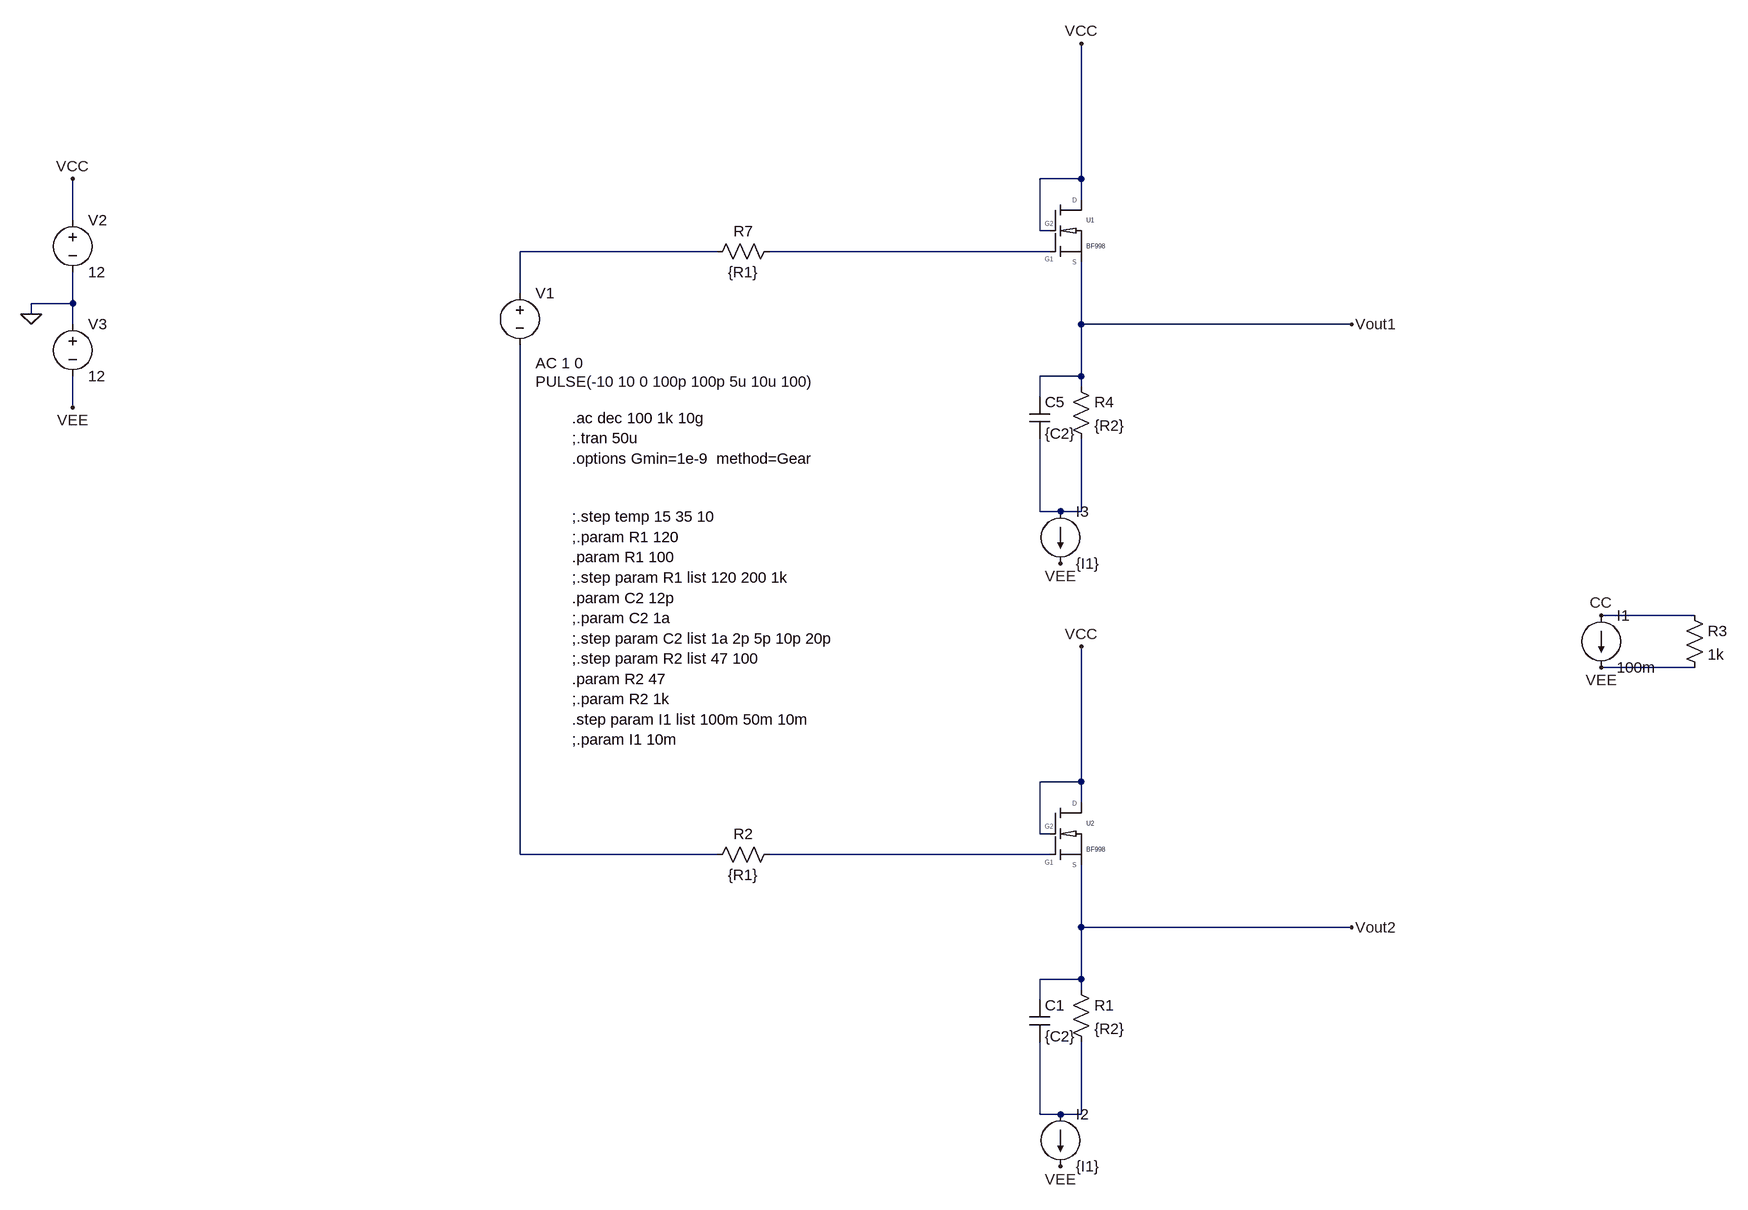
[diagram p0: schematic differential_probe_input_fet_bf998_one.asc]
differential_probe_input_fet_bf998_one.asc, the LTspice schematic file:
Version 4
SHEET 1 1224 1756
WIRE 224 96 224 -112
WIRE 224 96 160 96
WIRE 224 128 224 96
WIRE -1328 160 -1328 96
WIRE 160 176 160 96
WIRE 176 176 160 176
WIRE -336 208 -640 208
WIRE 176 208 -256 208
WIRE -640 272 -640 208
WIRE -1328 288 -1328 240
WIRE -1328 288 -1392 288
WIRE -1392 304 -1392 288
WIRE -1328 320 -1328 288
WIRE 224 320 224 224
WIRE 640 320 224 320
WIRE 224 400 224 320
WIRE 224 400 160 400
WIRE 224 416 224 400
WIRE 160 432 160 400
WIRE -1328 448 -1328 400
WIRE 160 608 160 496
WIRE 192 608 160 608
WIRE 224 608 224 496
WIRE 224 608 192 608
WIRE 1168 768 1024 768
WIRE 1168 848 1024 848
WIRE 224 1024 224 816
WIRE 224 1024 160 1024
WIRE 224 1056 224 1024
WIRE 160 1104 160 1024
WIRE 176 1104 160 1104
WIRE -640 1136 -640 352
WIRE -336 1136 -640 1136
WIRE 176 1136 -256 1136
WIRE 224 1248 224 1152
WIRE 640 1248 224 1248
WIRE 224 1328 224 1248
WIRE 224 1328 160 1328
WIRE 224 1344 224 1328
WIRE 160 1360 160 1328
WIRE 160 1536 160 1424
WIRE 192 1536 160 1536
WIRE 224 1536 224 1424
WIRE 224 1536 192 1536
FLAG 640 320 Vout1
FLAG -1392 304 0
FLAG 640 1248 Vout2
FLAG -1328 96 VCC
FLAG 224 -112 VCC
FLAG -1328 448 VEE
FLAG 1024 848 VEE
FLAG 192 1616 VEE
FLAG 224 816 VCC
FLAG 1024 768 CC
FLAG 192 688 VEE
SYMBOL res 208 400 R0
SYMATTR InstName R4
SYMATTR Value {R2}
SYMBOL res -240 192 R90
WINDOW 0 0 56 VBottom 2
WINDOW 3 32 56 VTop 2
SYMATTR InstName R7
SYMATTR Value {R1}
SYMBOL cap 144 432 R0
SYMATTR InstName C5
SYMATTR Value {C2}
SYMBOL voltage -640 256 R0
WINDOW 3 24 152 Left 2
WINDOW 123 24 124 Left 2
WINDOW 39 0 0 Left 0
SYMATTR Value PULSE(-10 10 0 100p 100p 5u 10u 100)
SYMATTR Value2 AC 1 0
SYMATTR InstName V1
SYMBOL voltage -1328 144 R0
WINDOW 123 0 0 Left 0
WINDOW 39 0 0 Left 0
SYMATTR InstName V2
SYMATTR Value 12
SYMBOL my\\BF998 176 128 R0
SYMATTR InstName U1
SYMBOL res 208 1328 R0
SYMATTR InstName R1
SYMATTR Value {R2}
SYMBOL res -240 1120 R90
WINDOW 0 0 56 VBottom 2
WINDOW 3 32 56 VTop 2
SYMATTR InstName R2
SYMATTR Value {R1}
SYMBOL cap 144 1360 R0
SYMATTR InstName C1
SYMATTR Value {C2}
SYMBOL voltage -1328 304 R0
WINDOW 123 0 0 Left 0
WINDOW 39 0 0 Left 0
SYMATTR InstName V3
SYMATTR Value 12
SYMBOL my\\BF998 176 1056 R0
SYMATTR InstName U2
SYMBOL current 1024 768 R0
WINDOW 123 0 0 Left 0
WINDOW 39 0 0 Left 0
SYMATTR InstName I1
SYMATTR Value 100m
SYMBOL res 1152 752 R0
SYMATTR InstName R3
SYMATTR Value 1k
SYMBOL current 192 1536 R0
WINDOW 123 0 0 Left 0
WINDOW 39 0 0 Left 0
SYMATTR InstName I2
SYMATTR Value {I1}
SYMBOL current 192 608 R0
WINDOW 123 0 0 Left 0
WINDOW 39 0 0 Left 0
SYMATTR InstName I3
SYMATTR Value {I1}
TEXT -560 464 Left 2 !.ac dec 100 1k 10g\n;.tran 50u\n.options Gmin=1e-9  method=Gear
TEXT -560 616 Left 2 !;.step temp 15 35 10\n;.param R1 120\n.param R1 100\n;.step param R1 list 120 200 1k\n.param C2 12p\n;.param C2 1a\n;.step param C2 list 1a 2p 5p 10p 20p\n;.step param R2 list 47 100\n.param R2 47\n;.param R2 1k\n.step param I1 list 100m 50m 10m\n;.param I1 10m

The netlist it stands for:
* differential_probe_input_fet_bf998_one.asc
R4 Vout1 N003 {R2}
R7 N002 N001 {R1}
C5 Vout1 N003 {C2}
V1 N001 N004 PULSE(-10 10 0 100p 100p 5u 10u 100) AC 1 0
V2 VCC 0 12
XU1 Vout1 VCC VCC N002 BF998  ; pins S D G2 G1
R1 Vout2 N006 {R2}
R2 N005 N004 {R1}
C1 Vout2 N006 {C2}
V3 0 VEE 12
XU2 Vout2 VCC VCC N005 BF998  ; pins S D G2 G1
I1 CC VEE 100m
R3 CC VEE 1k
I2 N006 VEE {I1}
I3 N003 VEE {I1}
.ac dec 100 1k 10g
;.tran 50u
.options Gmin=1e-9  method=Gear
;.step temp 15 35 10
;.param R1 120
.param R1 100
;.step param R1 list 120 200 1k
.param C2 12p
;.param C2 1a
;.step param C2 list 1a 2p 5p 10p 20p
;.step param R2 list 47 100
.param R2 47
;.param R2 1k
.step param I1 list 100m 50m 10m
;.param I1 10m
.lib BF998.sub
.backanno
.end